# Altium schematic sheet dac_with_external_vref.SchDoc
size 297 x 209 mm
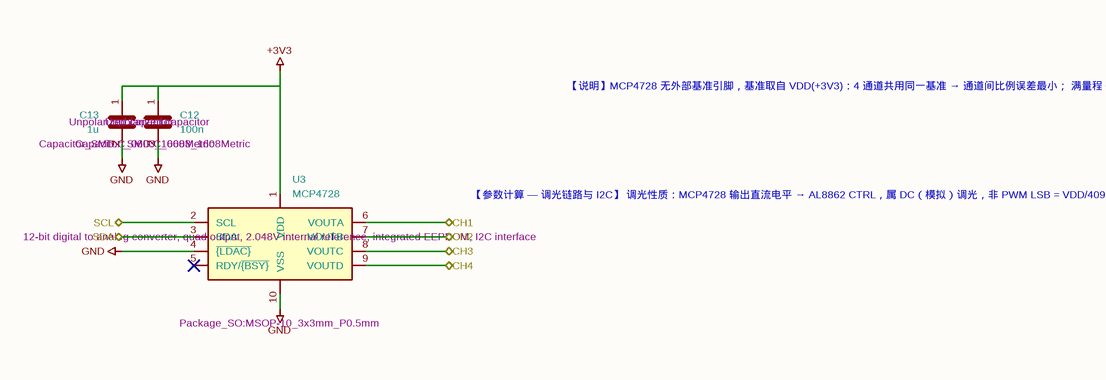
[diagram p0: dac_with_external_vref.SchDoc]

## Parts
C12  Description: Unpolarized capacitor  Footprint: Capacitor_SMD:C_0603_1608Metric  [C_0603_1608Metric]  (hidden comment: 100n)
C13  Description: Unpolarized capacitor  Footprint: Capacitor_SMD:C_0603_1608Metric  [C_0603_1608Metric]  (hidden comment: 1u)
U3  Description: 12-bit digital to analog converter, quad output, 2.048V internal reference, integrated EEPROM, I2C interface  Footprint: Package_SO:MSOP-10_3x3mm_P0.5mm  [MSOP-10_3x3mm_P0.5mm]  (hidden comment: MCP4728)

## Ports
CH1 (bidir), CH2 (bidir), CH3 (bidir), CH4 (bidir), SCL (bidir), SDA (bidir)

## Nets
+3V3: C12.1 C13.1 U3.1(VDD)
GND: C12.2 C13.2 U3.4(~{{LDAC}}) U3.10(VSS)
CH1: U3.6(VOUTA) ; port CH1
CH2: U3.7(VOUTB) ; port CH2
CH3: U3.8(VOUTC) ; port CH3
CH4: U3.9(VOUTD) ; port CH4
SCL: U3.2(SCL) ; port SCL
SDA: U3.3(SDA) ; port SDA

Not connected (* = marked no-connect by the designer): U3 5(RDY/~{{BSY}})*

## Notes on the sheet
- 【说明】MCP4728 无外部基准引脚，基准取自 VDD(+3V3)：4 通道共用同一基准 → 通道间比例误差最小；
  满量程 0~3.3 V，覆盖 AL8862 CTRL 的 0.4~2.5 V 全调光段。（若必须外部基准，可改 DAC7574）
  【LAYOUT】VDD 的 100nF 紧靠引脚 1 并直接回地；I2C 短且远离 SW 节点；四路 VOUT 等长同层，避免与 SW 平行
- 【参数计算 — 调光链路与 I2C】
  调光性质：MCP4728 输出直流电平 → AL8862 CTRL，属 DC（模拟）调光，非 PWM
  LSB = VDD/4096 = 3.3/4096 = 0.806 mV
  CTRL 0.4 V→10%、2.5 V→100% ⇒ 代码 497→3102（2605 级覆盖 10~100%，约 0.035%/级）
  （对照：PWM 调光需 CTRL 在 <0.3 V 与 >2.6 V 间切换，本设计不用）
  I2C 上拉：Rp,max = tr/(0.847·Cb)；400 kHz 时 tr ≤ 300 ns，板内 Cb≈50 pF ⇒ Rp ≤ 7 kΩ
  现用 4k7 → tr = 0.847×4.7k×50p = 199 ns ✔（外接排线 Cb>75 pF 时需降到 3.3k 以下）
- 1
- 2
- 3
- 4
- 5
- 6
- A
- B
- C
- DAC：MCP4728（I2C，4×12 位，LCSC 待选）
- 基准：内部 VDD 基准（MCP4728 无外部基准引脚）
- 输出：CH1~CH4 → AL8862 CTRL 调光
- D
- Title: I2C 四通道 DAC — MCP4728
- File: dac_with_external_vref.kicad_sch
- Sheet: /
- integrating_box_light_source
- KiCad E.D.A.  kicad (5.1.4)-1
- Size: A4
- Date: 2026-11-08
- Rev: A
- Id: 1/1

## Library data of the parts
C12 C13 = C
  C12: Value: 100n
  C13: Value: 1u
U3 = MCP4728: Value: MCP4728